# EAGLE design granny-nanny (EAGLE 9.6.0)
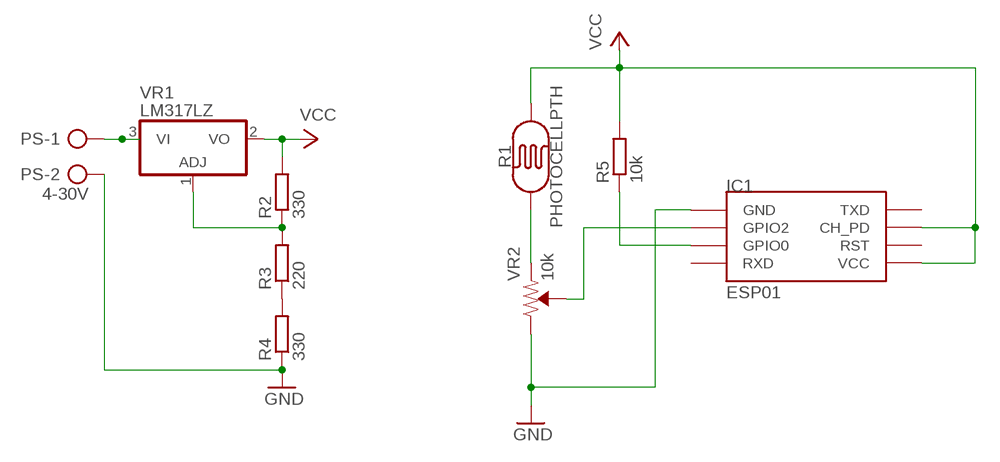
[diagram p0: schematic, sheet 1]

## Parts
IC1  ESP01  [ESP01]
PS  4-30V  AK500/2  [AK500/2]
R1  PHOTOCELLPTH  [PHOTOCELL]
R2  330  R-EU_0207/10  [0207/10]
R3  220  R-EU_0207/10  [0207/10]
R4  330  R-EU_0207/10  [0207/10]
R5  10k  R-EU_0207/10  [0207/10]
VR1  LM317LZ  [TO92]
VR2  10k  TRIMPOT-PTH-10MM-KNOB-1/2W-10%  [TRIMPOT-PTH-3386U]

## Nets
GND: IC1.GND PS.2 R4.1 VR2.3(CW)
N$1: PS.1 VR1.3(VI)
N$2: R2.1 R3.2 VR1.1(ADJ)
N$3: R3.1 R4.2
N$4: R1.1 VR2.1(CCW)
N$5: IC1.GPIO2 VR2.2(WIPER)
N$8: IC1.GPIO0 R5.1
VCC: IC1.CH_PD IC1.VCC R1.2 R2.2 R5.2 VR1.2(VO)
Unconnected: IC1.RST IC1.RX(RXD) IC1.TX(TXD)

## Library data of the parts
IC1 = esp8266modules:ESP01: ESP8266 Wifi module 01
PS = con-ptr500:AK500/2: CONNECTOR; OC_FARNELL: unknown; OC_NEWARK: unknown
R1 = SparkFun-Sensors:PHOTOCELL: Photocell (Photodetector, Photo Resistor, CdS) This is a very small light sensor. A photocell changes (also called a photodetector, photo resistor, CdS or photoconductive cell) resistance depending on the amount of light it is exposed to. These little sensors make great ambient light triggers (when light in the room turns on, do something). Datasheet <http://cdn.sparkfun.com/datasheets/Sensors/LightImaging/SEN-09088.pdf> SparkFun Products Mini Photocell <https://www.sparkfun.com/products/9088> (SEN-09088); PROD_ID: COMP-09129; SF_ID: SEN-09088
R2-R5 = rcl:R-EU_: RESISTOR, European symbol; SPICEPREFIX: R
VR1 = linear:*317: Positive VOLTAGE REGULATOR
VR2 = SparkFun-Resistors:TRIMPOT: Trimming Potentiometer (Trimpot) Three-terminal potentiometers, with an adjustable wiper and two adjustable resistors. A pot can be used to create a configurable voltage divider, or as a variable resistor. "Trimpots" are a subset of potentiometers, usually intended for "set-and-forget" applications. They're often more delicate than standard potentiometers - rated for fewer turns. Variants PTH-KNOB - PTH Trimpot w/ finger-adjustable knob Trimpot 10K with Knob <https://www.sparkfun.com/products/9806> (COM-09806) Datasheet <http://www.sparkfun.com/datasheets/Components/General/TSR-3386.pdf> SMD-3MM-CLOSED-FRAME - SMD 3mm Square Closed-Frame Trimpot Used on e.g. EasyDriver - Stepper Motor Driver <https://www.sparkfun.com/products/12779> Datasheet <http://www.bitechnologies.com/pdfs/22.pdf> (22AR10KTR) SMD-5MM - SMD 5mm Square Closed-Frame Trimpot Used on e.g. IOIO-OTG - V2.2 <https://www.sparkfun.com/products/13613> Datasheet <http://www.vishay.com/docs/51008/ts53.pdf> (TS53YL502MR10) SMD-3MM-1/10W-25% - 3mm Square Open-Frame Trimpot Used on e.g. SparkFun Shapeoko <https://www.sparkfun.com/products/13899> Datasheet <http://www.bourns.com/docs/Product-Datasheets/TC33.pdf> (TC33X-2-103E); PROD_ID: RES-09730; SF_SKU: COM-09806

## Board
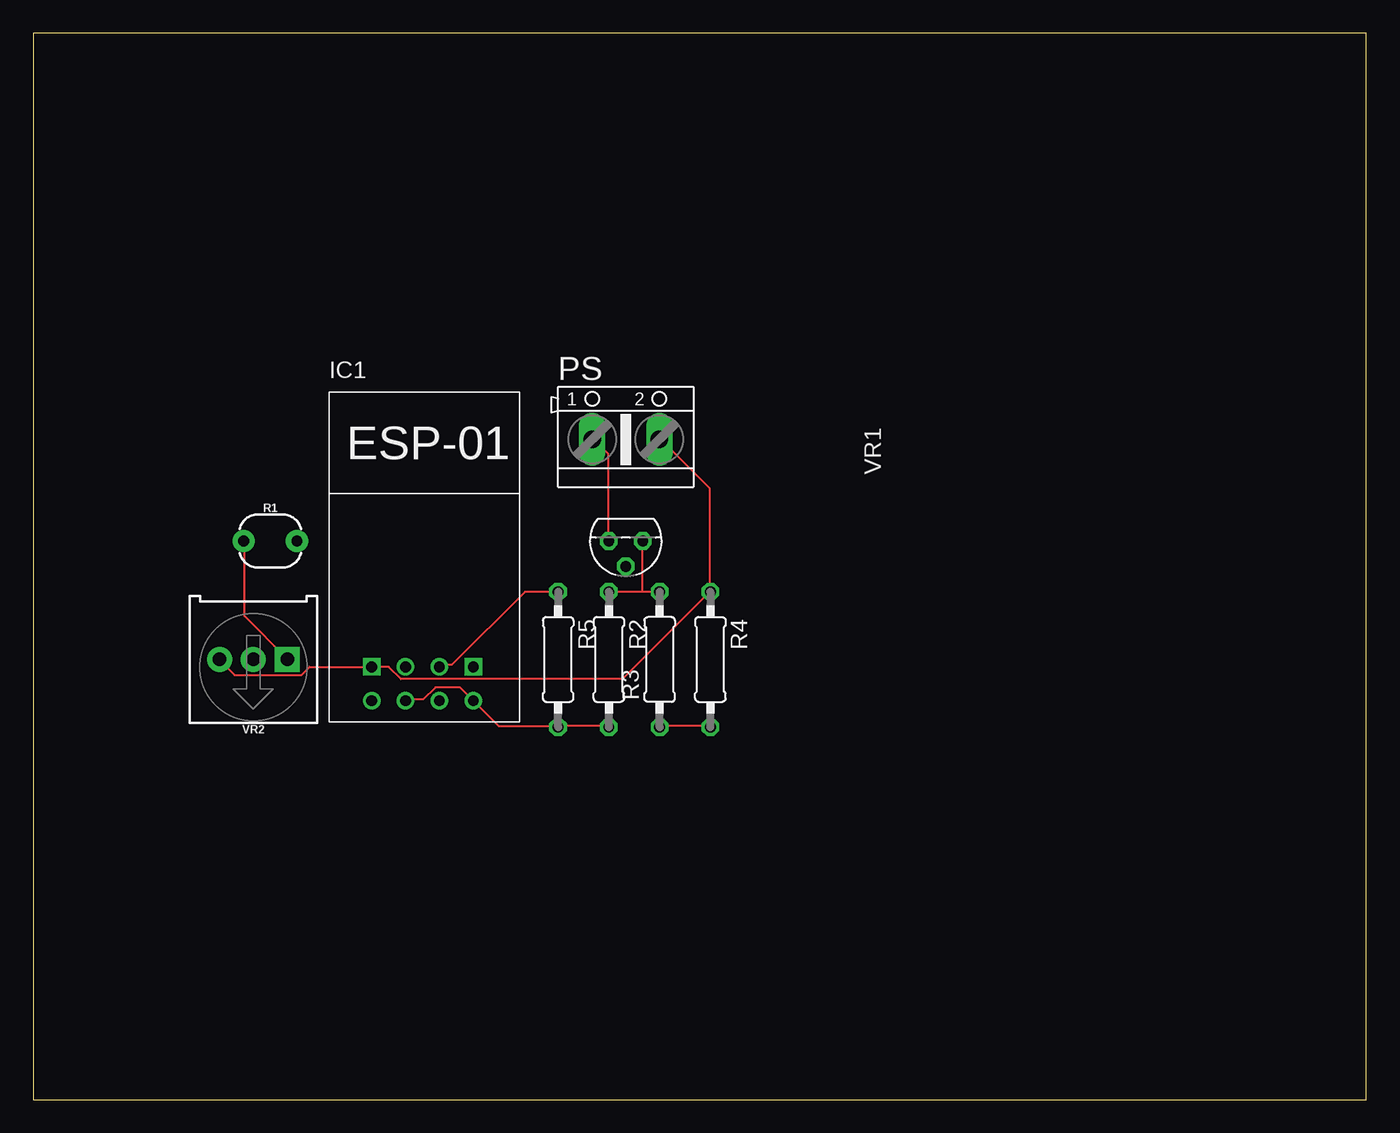
[diagram p1: board, top side]
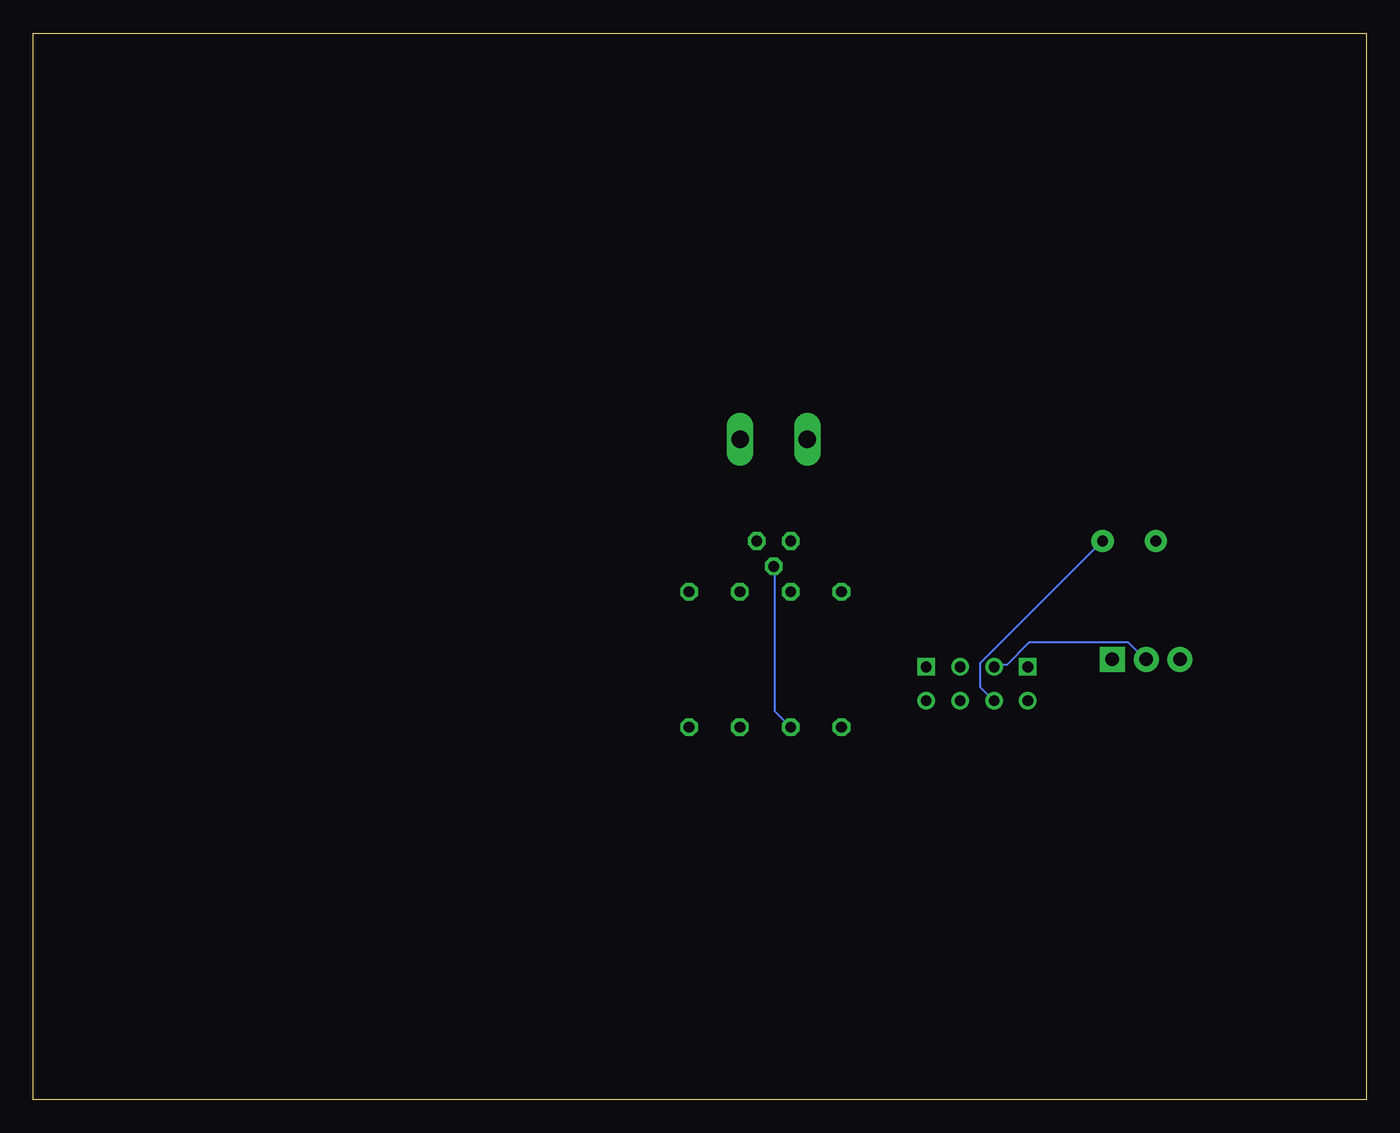
[diagram p2: board, bottom side, seen from below]

Size 100 x 80 mm. Coordinates in mm from the lower left corner, seen from the top.
Outline: 0,0 100,0 100,80 0,80 0,0
Copper layers (1*16): Top 0.035mm / dielectric 1.5mm / Bottom 0.035mm
Design rules "default": minimum track width 6mil, minimum drill 0.35mm, track to track 6mil, track to pad 6mil, pad to pad 6mil, via to via 6mil, smd to smd 6mil, copper to edge 40mil, drill to drill 6mil, minimum pad ring 10mil, minimum via ring 8mil, stop-mask expansion 4mil, vias tented up to drill 0mil, thermal gap 10mil

### Footprints (pad centres in the part's own frame; a part is rotated, then mirrored left to right if it is on the bottom)
ESP01 = drill 0.8: CH_PD -1.285,-8.178; GPIO0 1.255,-5.638; GPIO2 -1.285,-5.638; RST 1.255,-8.178; TX -3.825,-8.178; VCC 3.795,-8.178 | drill 0.8 square: GND -3.825,-5.638; RX 3.795,-5.638
AK500/2 = drill 1.321 long: 1 -2.515,0; 2 2.515,0
PHOTOCELL = drill 0.8 pad 1.676: 1 -2,0; 2 2,0
0207/10 = drill 0.813 octagon: 1 -5.08,0; 2 5.08,0
TO92 = drill 0.813 octagon: 1 -1.27,0; 2 0,1.905; 3 1.27,0
TRIMPOT-PTH-3386U = drill 1.016 pad 1.88 square: 1 -2.54,-0.015 | drill 1.016 pad 1.88: 2 0,-0.015; 3 2.54,-0.015

### Placement (x,y rotation side)
IC1  29.21,38.1 0 top
PS  44.45,49.53 0 top
R1  17.78,41.91 0 top
R2  43.18,33.02 270 top
R3  46.99,33.02 90 top
R4  50.8,33.02 270 top
R5  39.37,33.02 270 top
VR1  44.45,41.91 180 top
VR2  16.51,33.02 180 top

### Tracks (layer width: path | path; a pad name or v marks a point on that pad's centre or on a via)
GND
  Top 0.152: VR2.3 14.02,32.92 15.09,31.85 20.12,31.85 20.73,32.46 25.3,32.46 IC1.GND 25.45,32.46 26.67,32.46 27.58,31.55 44.2,31.55 50.75,38.1 | 50.75,38.1 50.75,45.87 47.09,49.53 PS.2 | 50.75,38.1 R4.1
N$1
  Top 0.152: VR1.3 43.13,41.91 43.13,48.46 42.06,49.53 PS.1
N$2
  Top 0.152: R3.2 45.72,38.1 | 45.72,38.1 R2.1 | 45.72,38.1 VR1.1
N$3
  Top 0.152: R3.1 47.09,28.04 50.75,28.04 R4.2
N$4
  Top 0.152: R1.1 15.85,41.91 15.85,36.27 19.05,33.07 VR2.1
N$5
  Bottom 0.152: IC1.GPIO2 27.89,32.61 26.98,32.61 25.3,34.29 17.83,34.29 16.61,33.07 VR2.2
N$8
  Top 0.152: R5.1 36.88,38.1 31.39,32.61 30.48,32.61 IC1.GPIO0
VCC
  Top 0.152: R2.2 43.13,28.04 39.47,28.04 R5.2 39.32,28.04 34.9,28.04 33.07,29.87 IC1.VCC 32.92,30.02 32,30.94 30.18,30.94 29.26,30.02 28.04,30.02 IC1.CH_PD
  Bottom 0.152: R2.2 44.35,29.11 44.35,39.93 VR1.2 | R1.2 19.81,41.91 28.96,32.77 28.96,30.94 28.04,30.02 IC1.CH_PD